# Altium schematic sheet altium_design_first.SchDoc
size A4
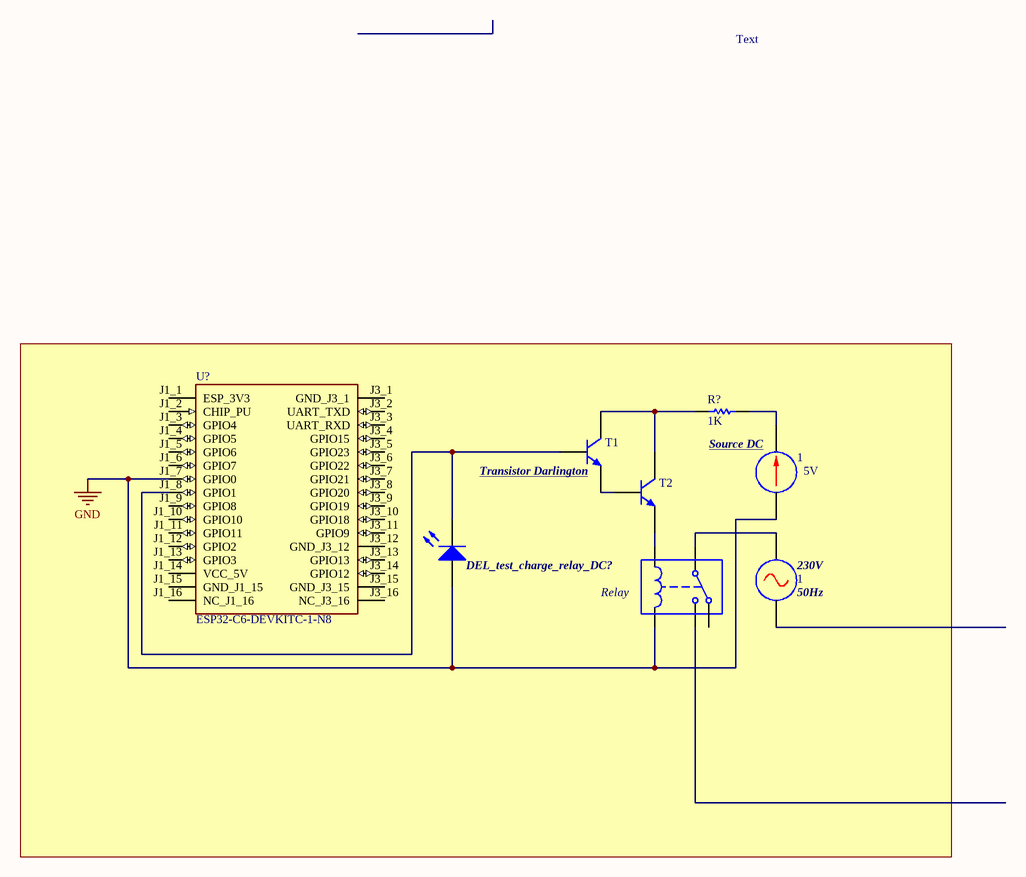
[diagram p0: altium_design_first.SchDoc]

## Parts
1  DC: 5V  (hidden comment: DC Current Source)
230V  Amp: 1  Freq: 50Hz  (hidden comment: AC Voltage Source)
DEL_test_charge_relay_DC?  Light-Emitting Diode  (value not drawn)
R?  value 1K  (hidden comment: Resistor)
Relay  Single-Pole, Double-Throw Relay  (value not drawn)
T1  Bipolar NPN 3 Pins Transistor Gummel-Poon Model  (value not drawn)
T2  Bipolar NPN 3 Pins Transistor Gummel-Poon Model  (value not drawn)
U?  ESP32-C6-DEVKITC-1-N8  [MODULE_ESP32-C6-DEVKITC-1-N8]

## Nets
GND: 1.2(-) DEL_test_charge_relay_DC?.1(A) Relay.5 U?.J1_7(GPIO0)
Net1_1: 1.1(+) R?.2
Net230V_1: 230V.1 Relay.1
NetDEL_test_charge_relay_DC?_2: DEL_test_charge_relay_DC?.2(K) T1.2(B) U?.J1_8(GPIO1)
NetR?_1: R?.1 T1.1(C) T2.1(C)
NetRelay_4: Relay.4 T2.3(E)
NetT1_3: T1.3(E) T2.2(B)

Not connected (* = marked no-connect by the designer): 230V 2; Relay 2 3; U? J1_1(ESP_3V3) J1_2(CHIP_PU) J1_3(GPIO4) J1_4(GPIO5) J1_5(GPIO6) J1_6(GPIO7) J1_9(GPIO8) J1_10(GPIO10) J1_11(GPIO11) J1_12(GPIO2) J1_13(GPIO3) J1_14(VCC_5V) J1_15(GND_J1_15) J1_16(NC_J1_16) J3_1(GND_J3_1) J3_2(UART_TXD) J3_3(UART_RXD) J3_4(GPIO15) J3_5(GPIO23) J3_6(GPIO22) J3_7(GPIO21) J3_8(GPIO20) J3_9(GPIO19) J3_10(GPIO18) J3_11(GPIO9) J3_12(GND_J3_12) J3_13(GPIO13) J3_14(GPIO12) J3_15(GND_J3_15) J3_16(NC_J3_16)

## Notes on the sheet
- Text
- (near T1) Transistor Darlington
- (near 1) Source DC

## Library data of the parts
1 = DC Current Source: SimulationGenericComponent: True
230V = AC Voltage Source: SimulationGenericComponent: True; DC: 0; Phase: 0; Rser: 0; Cpar: 0
DEL_test_charge_relay_DC? = LED: AF: 1; BV: 0; BV_MAX: 1e99; EG: 1.11; FC: 0.5; IBV: 0.001; IS: 1e-14; MJSW: 0.33; NTUN: 30; TNOM: 27; XTI: 3; SimulationGenericComponent: True; CJO: 0; CJP: 0; CTA: 0; CTP: 0; FCS: 0.5; FV_MAX: 1e99; IKF: 0; IKR: 0; ISR: 1e-14; JSW: 0; JTUN: 0; JTUNSW: 0; KEG: 1; KF: 0; LEVEL: 1; N: 1; NBV: 1; NR: 1; NS: 1; PHP: 1; RS: 0; TCV: 0; TLEV: 0; TLEVC: 0; TM1: 0; TM2: 0; TPB: 0; TPHP: 0; TRS: 0; TRS2: 0; TT: 0; TTT1: 0; TTT2: 0; VJ: 1; XTITUN: 3
R? = Resistor: TC1: 0; SimulationGenericComponent: True; TC2: 0
Relay = SPDT Relay: L_C: 1u; R_C: 100; RON: 1; ROFF: 1e12; ION: 1m; IOFF: 0; SimulationGenericComponent: True
T1 T2 = BJT NPN_GP: SimulationGenericComponent: True; BF: 100; AF: 0; BR: 1; EG: 1.11; FC: 0.5; IS: 1e-16; MJC: 0.33; NC: 2; NE: 1.5; TNOM: 27; VBC_MAX: 1e99; VJC: 0.75; XTI: 3; CJC: 0; CJE: 0; CJS: 0; CTC: 0; CTE: 0; CTS: 0; IKF: 0; IKR: 0; IRB: 0; ISC: 0; ISE: 0; ISS: 0; ITF: 0; KF: 0; MJE: 0.33; MJS: 0; NF: 1; NKF: 0.5; NR: 1; NS: 1; PTF: 0; RB: 0; RBM: 0; RC: 0; RE: 0; SUBS: 1; TBF1: 0; TBF2: 0; TBR1: 0; TBR2: 0; TF: 0; TIKF1: 0; TIKF2: 0; TIKR1: 0; TIKR2: 0; TIRB1: 0; TIRB2: 0; TIS1: 0; TIS2: 0; TISC1: 0; TISC2: 0; TISE1: 0; TISE2: 0; TITF1: 0; TITF2: 0; TLEV: 0; TLEVC: 0; TMJC1: 0; TMJC2: 0; TMJE1: 0; TMJE2: 0; TMJS1: 0; TMJS2: 0; TNC1: 0; TNC2: 0; TNE1: 0; TNE2: 0; TNF1: 0; TNF2: 0; TNR1: 0; TNR2: 0; TNS1: 0; TNS2: 0; TR: 0; TRB1: 0; TRB2: 0; TRC1: 0; TRC2: 0; TRE1: 0; TRE2: 0; TRM1: 0; TRM2: 0; TTF1: 0; TTF2: 0; TTR1: 0; TTR2: 0; TVAF1: 0; TVAF2: 0; TVAR1: 0; TVAR2: 0; TVJC: 0; TVJE: 0; TVJS: 0; VAF: 0; VAR: 0; VBE_MAX: 1e99; VCE_MAX: 1e99; VJE: 0.75; VJS: 0.75; VTF: 0; XCJC: 1; XTB: 0; XTF: 0
U? = ESP32-C6-DEVKITC-1-N8: The ESP32-C6-DEVKITC-1-N8 from Espressif Systems is a development board designed for RF, RFID, and wireless applications. Built around the ESP32-C6-WROOM-1 module, it supports multiple connectivity options including 802.11 b/g/n/ax Wi-Fi, BluetoothÂ® (BLE; SnapEDA_Link: https://www.snapeda.com/parts/ESP32-C6-DEVKITC-1-N8/Espressif+Systems/view-part/?ref=snap; Package: None; Value: *; MF: Espressif Systems; MP: ESP32-C6-DEVKITC-1-N8; Check_prices: https://www.snapeda.com/parts/ESP32-C6-DEVKITC-1-N8/Espressif+Systems/view-part/?ref=eda